# Altium schematic sheet fonts.SchDoc
size 254 x 203 mm
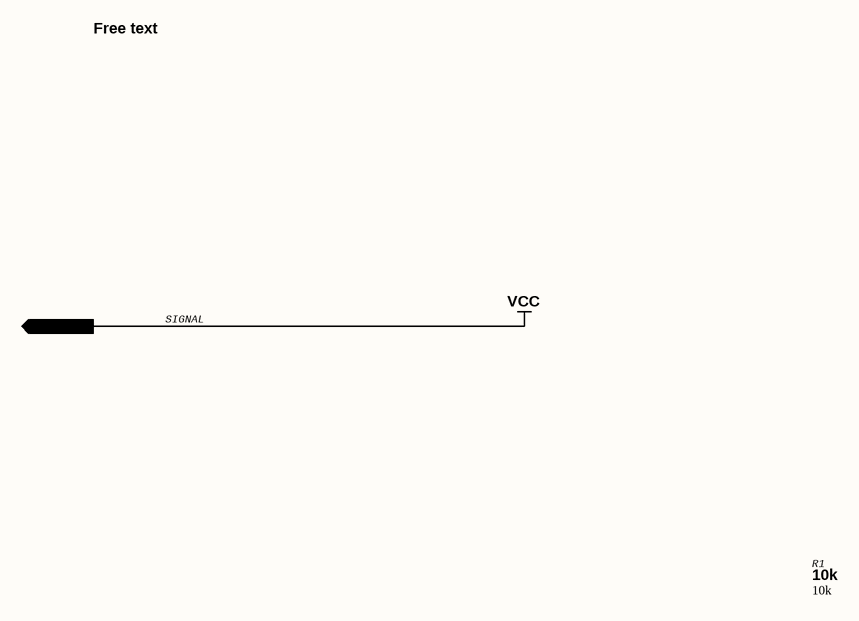
[diagram p0: fonts.SchDoc]

## Parts
R1  10k

## Ports
IN (out)

## Notes on the sheet
- Free text

## Library data of the parts
R1 = Resistor: Value: 10k